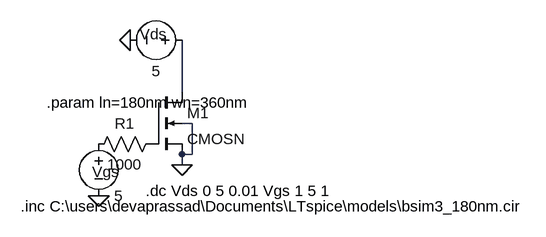
[diagram p0: schematic VdsvsId.asc]
VdsvsId.asc, the LTspice schematic file:
Version 4.1
SHEET 1 880 680
WIRE 176 128 176 48
WIRE 192 176 176 176
WIRE 192 224 192 176
WIRE 192 224 176 224
WIRE 176 240 176 224
FLAG 176 240 0
FLAG 96 48 0
FLAG 48 288 0
SYMBOL nmos4 128 128 R0
SYMATTR InstName M1
SYMATTR Value2 l={ln} w={wn}
SYMATTR Value CMOSN
SYMBOL voltage 48 192 R0
WINDOW 0 -10 59 Left 2
WINDOW 123 0 0 Left 0
WINDOW 39 0 0 Left 0
SYMATTR InstName Vgs
SYMATTR Value 5
SYMBOL voltage 192 48 R90
WINDOW 0 6 60 VBottom 2
WINDOW 3 32 56 VTop 2
WINDOW 123 0 0 Left 0
WINDOW 39 0 0 Left 0
SYMATTR InstName Vds
SYMATTR Value 5
SYMBOL res 144 192 R90
WINDOW 0 0 56 VBottom 2
WINDOW 3 32 56 VTop 2
SYMATTR InstName R1
SYMATTR Value 1000
TEXT 120 280 Left 2 !.dc Vds 0 5 0.01 Vgs 1 5 1
TEXT -72 304 Left 2 !.inc C:\\users\\devaprassad\\Documents\\LTspice\\models\\bsim3_180nm.cir
TEXT -32 144 Left 2 !.param ln=180nm wn=360nm

The netlist it stands for:
* VdsvsId.asc
M1 N001 P001 0 0 CMOSN l={ln} w={wn}
Vgs P002 0 5
Vds N001 0 5
R1 P001 P002 1000
.model NMOS NMOS
.model PMOS PMOS
.lib standard.mos
.dc Vds 0 5 0.01 Vgs 1 5 1
.inc C:\users\devaprassad\Documents\LTspice\models\bsim3_180nm.cir
.param ln=180nm wn=360nm
.backanno
.end